# Altium schematic sheet Harici Moduller.SchDoc
size A4; SheetNumber: 5; SheetTotal: 7
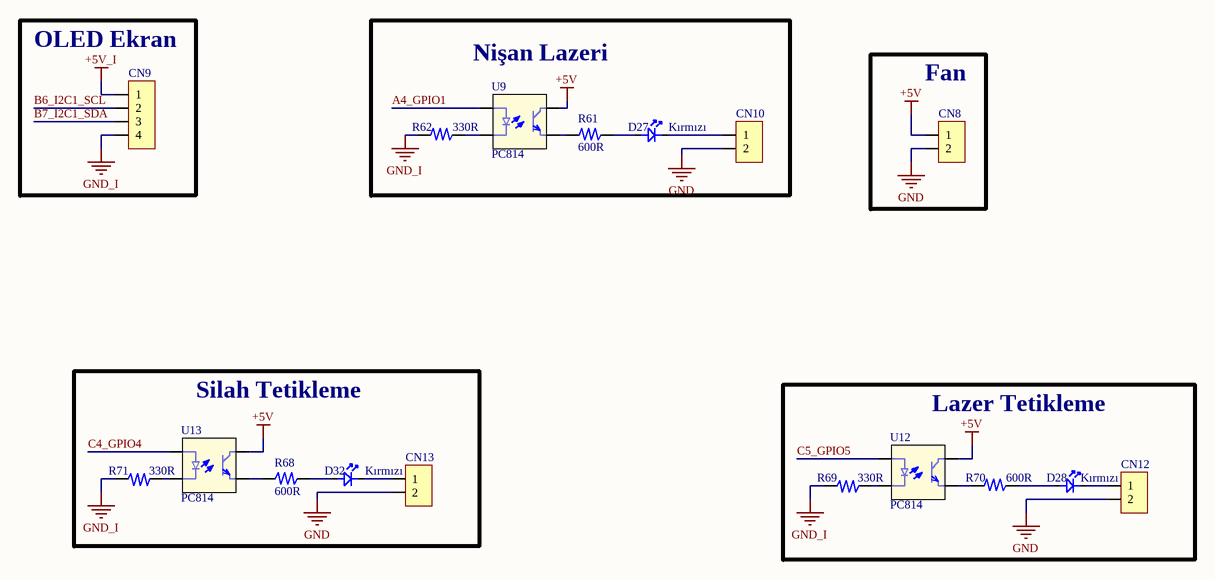
[diagram p0: Harici Moduller.SchDoc]

## Parts
CN8  2_Pin_JST_Male  [2_Pin_JST_Male]  (value not drawn)
CN9  4_Pin_JST_Male  [4_Pin_JST_Male]  (value not drawn)
CN10  2_Pin_JST_Male  [2_Pin_JST_Male]  (value not drawn)
CN12  2_Pin_JST_Male  [2_Pin_JST_Male]  (value not drawn)
CN13  2_Pin_JST_Male  [2_Pin_JST_Male]  (value not drawn)
D27  Kırmızı  [0805 LED]
D28  Kırmızı  [0805 LED]
D32  Kırmızı  [0805 LED]
R61  600R  [0805 Dırenc]
R62  330R  [0805 Dırenc]
R68  600R  [0805 Dırenc]
R69  330R  [0805 Dırenc]
R70  600R  [0805 Dırenc]
R71  330R  [0805 Dırenc]
U9  PC814  [SOIC4]
U12  PC814  [SOIC4]
U13  PC814  [SOIC4]

## Blocks framed on the sheet
OLED Ekran: CN9
Nişan Lazeri: CN10 D27 R61 R62 U9
Fan: CN8
Silah Tetikleme: CN13 D32 R68 R71 U13
Lazer Tetikleme: CN12 D28 R69 R70 U12

## Nets
+5V: CN8.1 U9.4 U12.4 U13.4
+5V_I: CN9.1
GND: CN8.2 CN10.2 CN12.2 CN13.2
GND_I: CN9.4 R62.1 R69.2 R71.2
A4_GPIO1: U9.1
B6_I2C1_SCL: CN9.2
B7_I2C1_SDA: CN9.3
C4_GPIO4: U13.1
C5_GPIO5: U12.1
NetCN10_1: CN10.1 D27.2
NetCN12_1: CN12.1 D28.2
NetCN13_1: CN13.1 D32.2
NetD27_1: D27.1 R61.2
NetD28_1: D28.1 R70.2
NetD32_1: D32.1 R68.2
NetR61_1: R61.1 U9.3
NetR62_2: R62.2 U9.2
NetR68_1: R68.1 U13.3
NetR69_1: R69.1 U12.2
NetR70_1: R70.1 U12.3
NetR71_1: R71.1 U13.2

## Library data of the parts
D27 D28 D32 = 0805 LED
R61 R62 R68-R71 = Direnc 0805
U9 U12 U13 = PC814: Description; Manufacturer_Name: Isocom; Manufacturer_Part_Number: IS2801-1; Type: Optoisolators; Copyright: Copyright (C) 2026 Ultra Librarian. All rights reserved.; RefDes: RefDes